# Altium schematic sheet DAC_4493.SchDoc
size 1188 x 840 mm; SheetNumber: 2; SheetTotal: 3
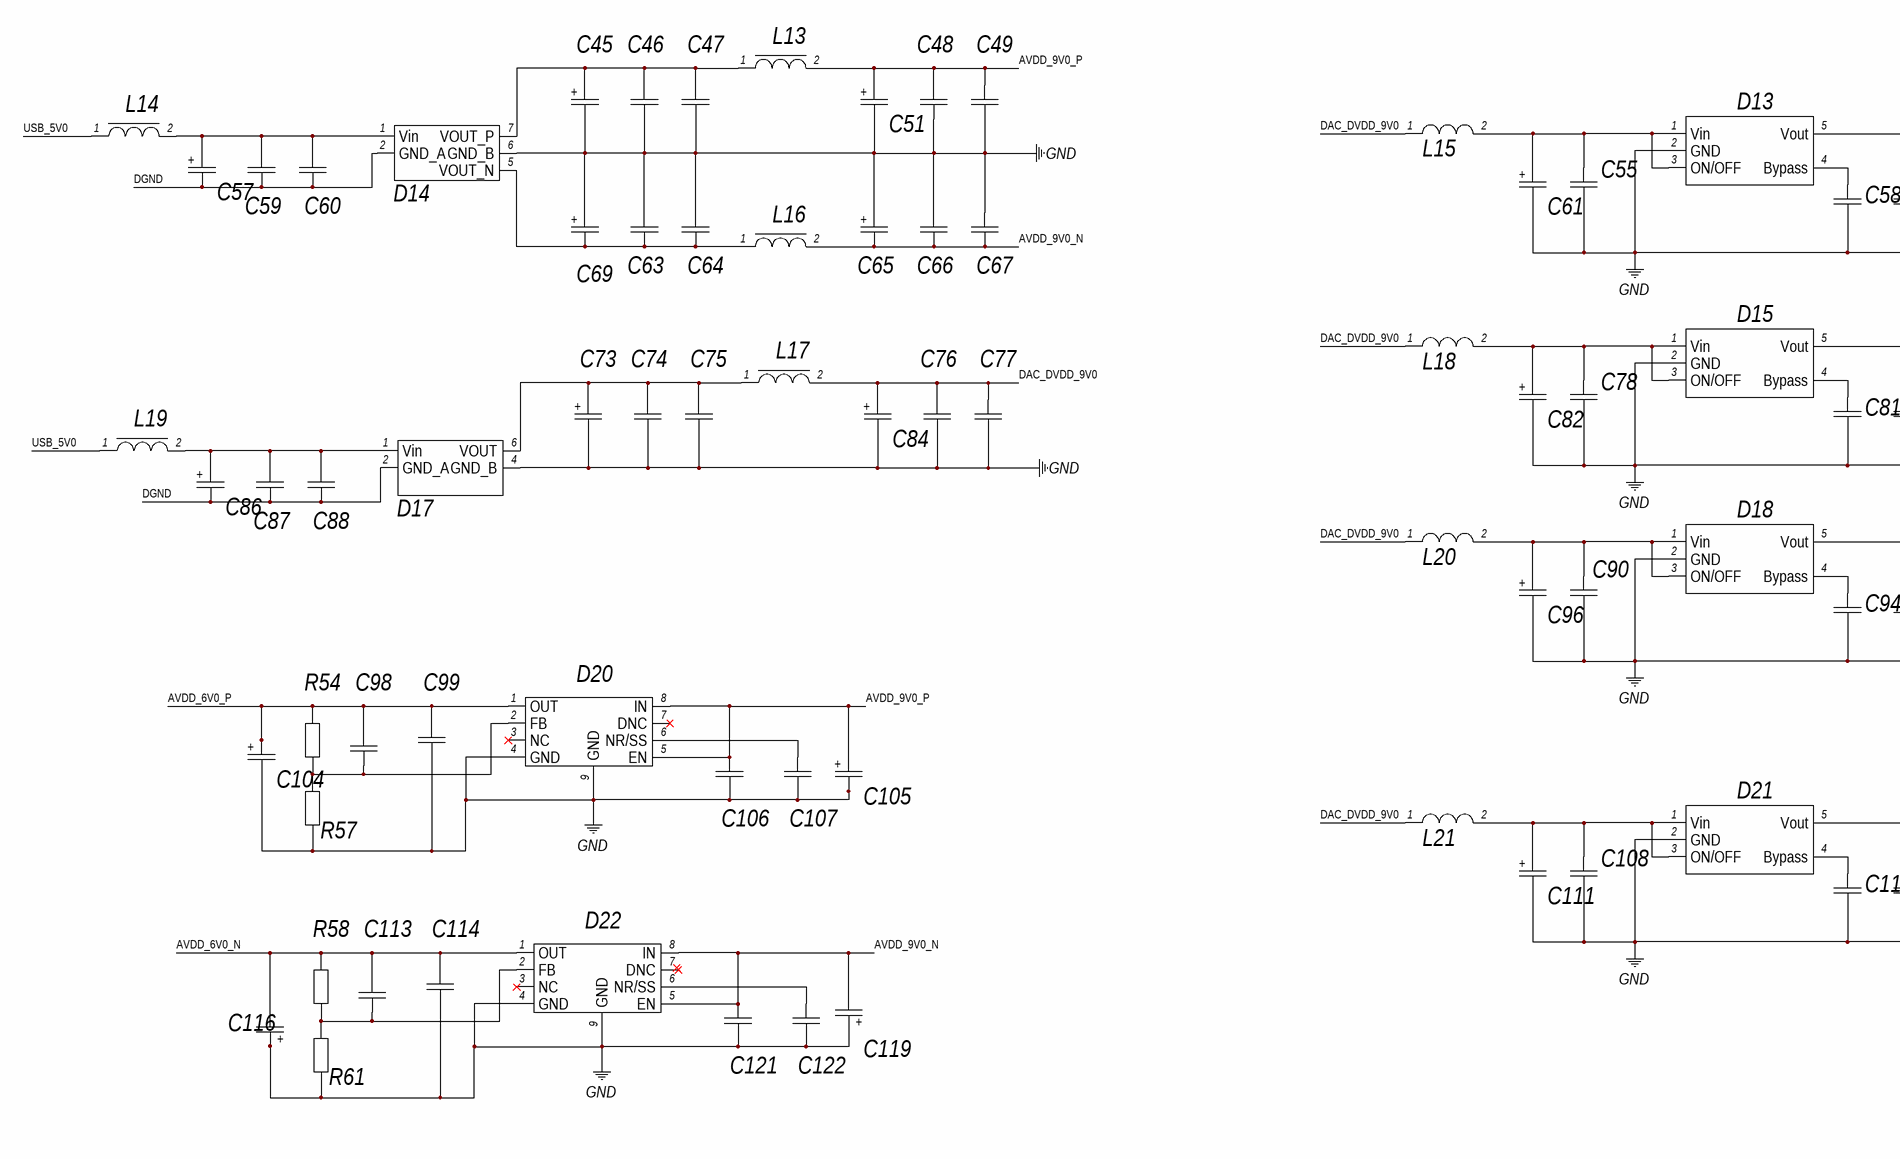
[diagram p0: DAC_4493.SchDoc, top left]
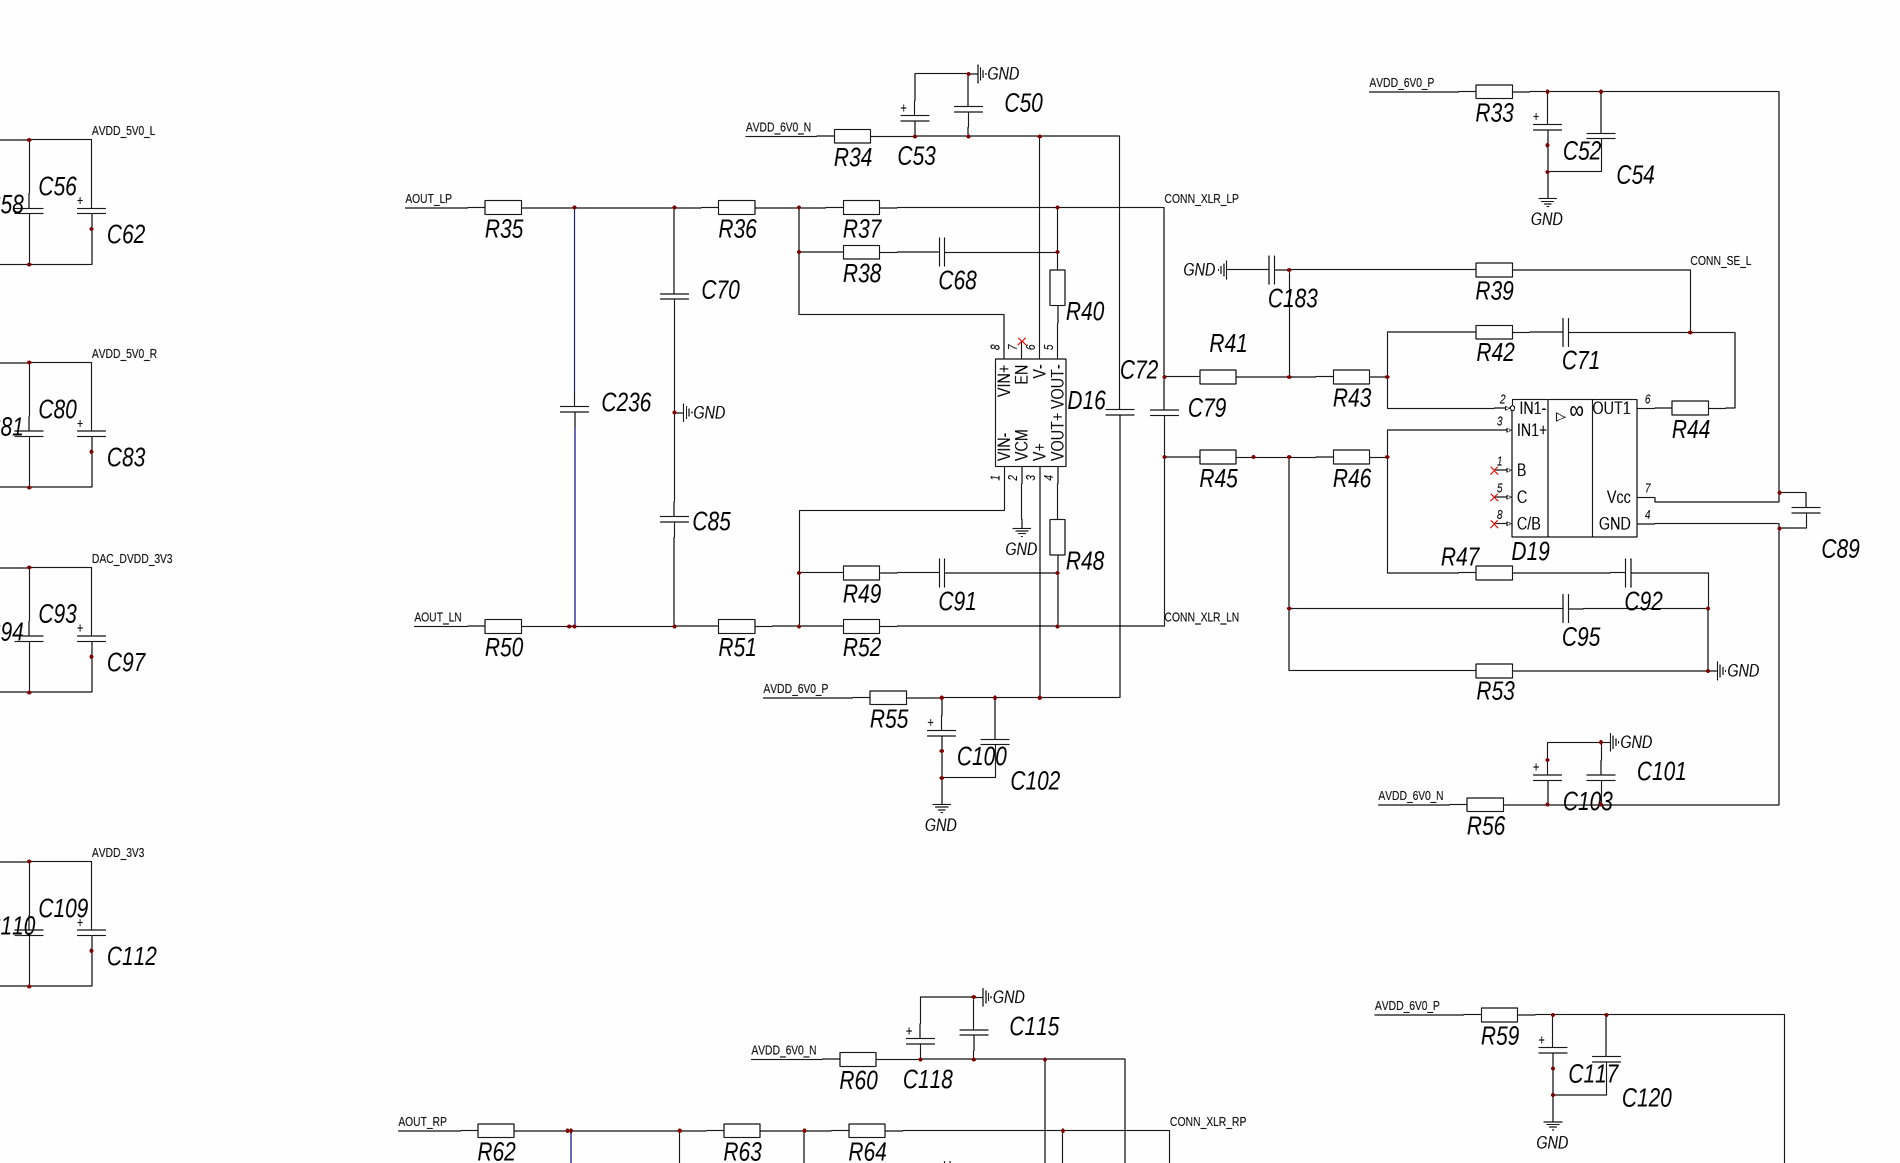
[diagram p1: DAC_4493.SchDoc, top right]
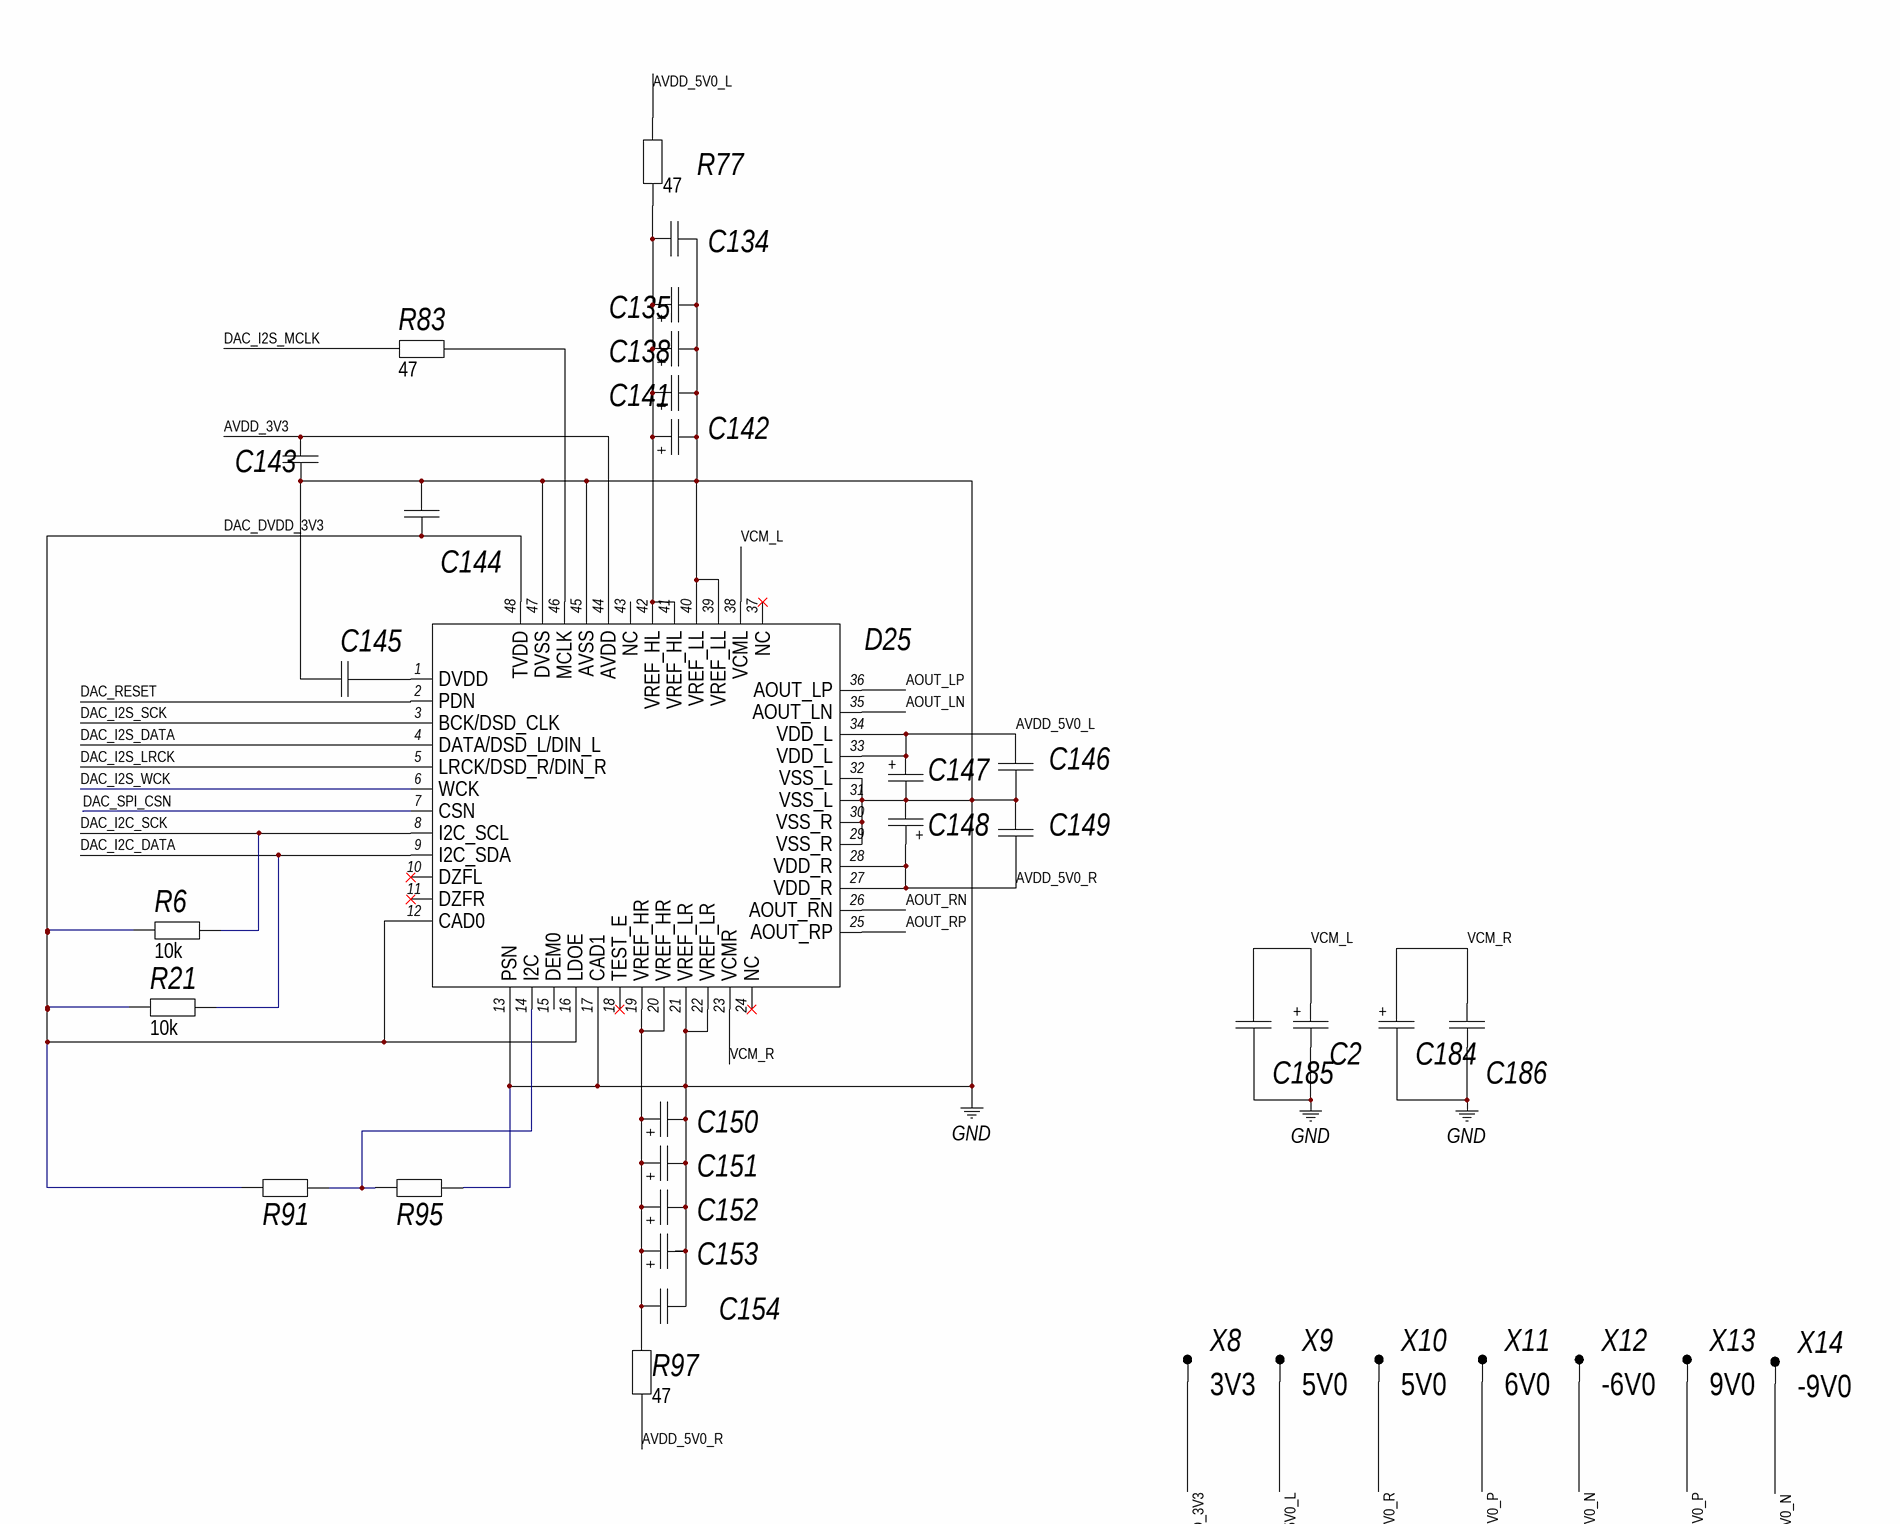
[diagram p2: DAC_4493.SchDoc, bottom left]
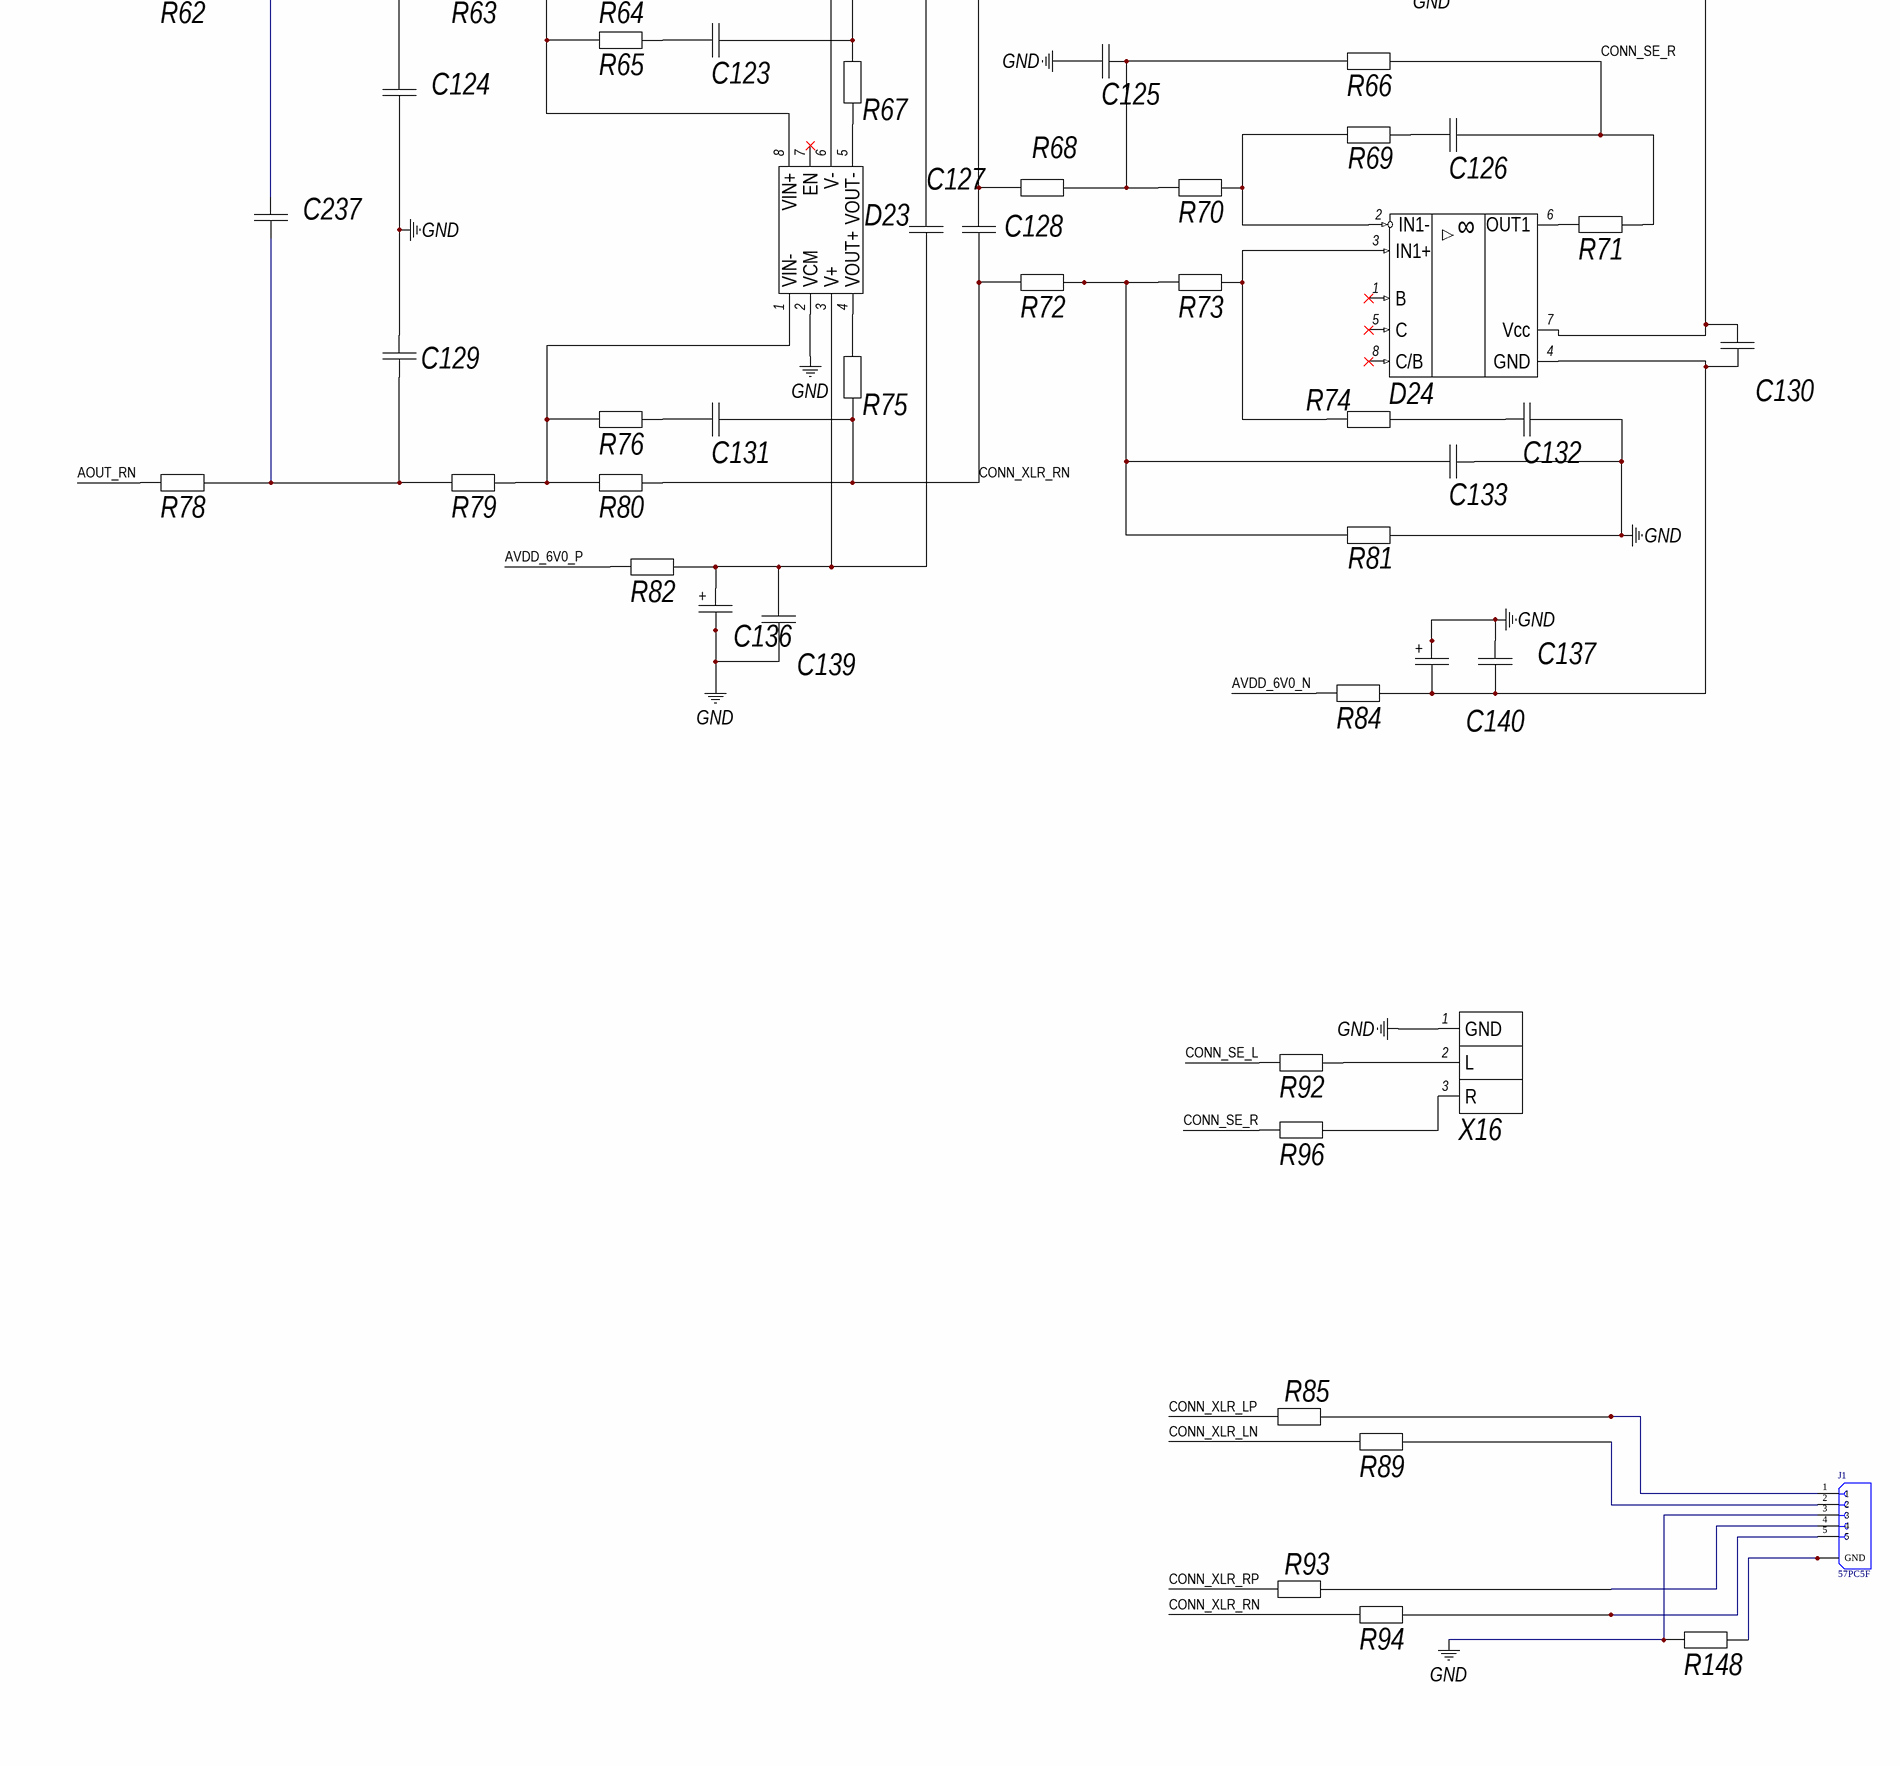
[diagram p3: DAC_4493.SchDoc, bottom right]

## Parts
C2  Обозначение при заказе  [TANT_B]  (value not drawn)
C45  Обозначение при заказе  [TANT_D]  (value not drawn)
C46  CC0805MRX7R9BB104  [CAPC200X125X95L50N]  (value not drawn)
C47  CC0805MRX7R9BB104  [CAPC200X125X95L50N]  (value not drawn)
C48  CC0805MRX7R9BB104  [CAPC200X125X95L50N]  (value not drawn)
C49  CC0805MRX7R9BB104  [CAPC200X125X95L50N]  (value not drawn)
C50  CC0805MRX7R9BB104  [CAPC200X125X95L50N]  (value not drawn)
C51  Обозначение при заказе  [TANT_D]  (value not drawn)
C52  Обозначение при заказе  [TANT_B]  (value not drawn)
C53  Обозначение при заказе  [TANT_B]  (value not drawn)
C54  CC0805MRX7R9BB104  [CAPC200X125X95L50N]  (value not drawn)
C55  CC0805MRX7R9BB104  [CAPC200X125X95L50N]  (value not drawn)
C56  CC0805MRX7R9BB104  [CAPC200X125X95L50N]  (value not drawn)
C57  Обозначение при заказе  [TANT_D]  (value not drawn)
C58  CC0805MRX7R9BB104  [CAPC200X125X95L50N]  (value not drawn)
C59  CC0805MRX7R9BB104  [CAPC200X125X95L50N]  (value not drawn)
C60  CC0805MRX7R9BB104  [CAPC200X125X95L50N]  (value not drawn)
C61  Обозначение при заказе  [TANT_B]  (value not drawn)
C62  Обозначение при заказе  [TANT_B]  (value not drawn)
C63  CC0805MRX7R9BB104  [CAPC200X125X95L50N]  (value not drawn)
C64  CC0805MRX7R9BB104  [CAPC200X125X95L50N]  (value not drawn)
C65  Обозначение при заказе  [TANT_D]  (value not drawn)
C66  CC0805MRX7R9BB104  [CAPC200X125X95L50N]  (value not drawn)
C67  CC0805MRX7R9BB104  [CAPC200X125X95L50N]  (value not drawn)
C68  CC0805MRX7R9BB104  [CAPC200X125X95L50N]  (value not drawn)
C69  Обозначение при заказе  [TANT_D]  (value not drawn)
C70  CC0805MRX7R9BB104  [CAPC200X125X95L50N]  (value not drawn)
C71  CC0805MRX7R9BB104  [CAPC200X125X95L50N]  (value not drawn)
C72  CC0805MRX7R9BB104  [CAPC200X125X95L50N]  (value not drawn)
C73  Обозначение при заказе  [TANT_D]  (value not drawn)
C74  CC0805MRX7R9BB104  [CAPC200X125X95L50N]  (value not drawn)
C75  CC0805MRX7R9BB104  [CAPC200X125X95L50N]  (value not drawn)
C76  CC0805MRX7R9BB104  [CAPC200X125X95L50N]  (value not drawn)
C77  CC0805MRX7R9BB104  [CAPC200X125X95L50N]  (value not drawn)
C78  CC0805MRX7R9BB104  [CAPC200X125X95L50N]  (value not drawn)
C79  CC0805MRX7R9BB104  [CAPC200X125X95L50N]  (value not drawn)
C80  CC0805MRX7R9BB104  [CAPC200X125X95L50N]  (value not drawn)
C81  CC0805MRX7R9BB104  [CAPC200X125X95L50N]  (value not drawn)
C82  Обозначение при заказе  [TANT_B]  (value not drawn)
C83  Обозначение при заказе  [TANT_B]  (value not drawn)
C84  Обозначение при заказе  [TANT_D]  (value not drawn)
C85  CC0805MRX7R9BB104  [CAPC200X125X95L50N]  (value not drawn)
C86  Обозначение при заказе  [TANT_D]  (value not drawn)
C87  CC0805MRX7R9BB104  [CAPC200X125X95L50N]  (value not drawn)
C88  CC0805MRX7R9BB104  [CAPC200X125X95L50N]  (value not drawn)
C89  CC0805MRX7R9BB104  [CAPC200X125X95L50N]  (value not drawn)
C90  CC0805MRX7R9BB104  [CAPC200X125X95L50N]  (value not drawn)
C91  CC0805MRX7R9BB104  [CAPC200X125X95L50N]  (value not drawn)
C92  CC0805MRX7R9BB104  [CAPC200X125X95L50N]  (value not drawn)
C93  CC0805MRX7R9BB104  [CAPC200X125X95L50N]  (value not drawn)
C94  CC0805MRX7R9BB104  [CAPC200X125X95L50N]  (value not drawn)
C95  CC0805MRX7R9BB104  [CAPC200X125X95L50N]  (value not drawn)
C96  Обозначение при заказе  [TANT_B]  (value not drawn)
C97  Обозначение при заказе  [TANT_B]  (value not drawn)
C98  CC0805MRX7R9BB104  [CAPC200X125X95L50N]  (value not drawn)
C99  CC0805MRX7R9BB104  [CAPC200X125X95L50N]  (value not drawn)
C100  Обозначение при заказе  [TANT_B]  (value not drawn)
C101  CC0805MRX7R9BB104  [CAPC200X125X95L50N]  (value not drawn)
C102  CC0805MRX7R9BB104  [CAPC200X125X95L50N]  (value not drawn)
C103  Обозначение при заказе  [TANT_B]  (value not drawn)
C104  Обозначение при заказе  [TANT_B]  (value not drawn)
C105  Обозначение при заказе  [TANT_B]  (value not drawn)
C106  CC0805MRX7R9BB104  [CAPC200X125X95L50N]  (value not drawn)
C107  CC0805MRX7R9BB104  [CAPC200X125X95L50N]  (value not drawn)
C108  CC0805MRX7R9BB104  [CAPC200X125X95L50N]  (value not drawn)
C109  CC0805MRX7R9BB104  [CAPC200X125X95L50N]  (value not drawn)
C110  CC0805MRX7R9BB104  [CAPC200X125X95L50N]  (value not drawn)
C111  Обозначение при заказе  [TANT_B]  (value not drawn)
C112  Обозначение при заказе  [TANT_B]  (value not drawn)
C113  CC0805MRX7R9BB104  [CAPC200X125X95L50N]  (value not drawn)
C114  CC0805MRX7R9BB104  [CAPC200X125X95L50N]  (value not drawn)
C115  CC0805MRX7R9BB104  [CAPC200X125X95L50N]  (value not drawn)
C116  Обозначение при заказе  [TANT_B]  (value not drawn)
C117  Обозначение при заказе  [TANT_B]  (value not drawn)
C118  Обозначение при заказе  [TANT_B]  (value not drawn)
C119  Обозначение при заказе  [TANT_B]  (value not drawn)
C120  CC0805MRX7R9BB104  [CAPC200X125X95L50N]  (value not drawn)
C121  CC0805MRX7R9BB104  [CAPC200X125X95L50N]  (value not drawn)
C122  CC0805MRX7R9BB104  [CAPC200X125X95L50N]  (value not drawn)
C123  CC0805MRX7R9BB104  [CAPC200X125X95L50N]  (value not drawn)
C124  CC0805MRX7R9BB104  [CAPC200X125X95L50N]  (value not drawn)
C125  CC0805MRX7R9BB104  [CAPC200X125X95L50N]  (value not drawn)
C126  CC0805MRX7R9BB104  [CAPC200X125X95L50N]  (value not drawn)
C127  CC0805MRX7R9BB104  [CAPC200X125X95L50N]  (value not drawn)
C128  CC0805MRX7R9BB104  [CAPC200X125X95L50N]  (value not drawn)
C129  CC0805MRX7R9BB104  [CAPC200X125X95L50N]  (value not drawn)
C130  CC0805MRX7R9BB104  [CAPC200X125X95L50N]  (value not drawn)
C131  CC0805MRX7R9BB104  [CAPC200X125X95L50N]  (value not drawn)
C132  CC0805MRX7R9BB104  [CAPC200X125X95L50N]  (value not drawn)
C133  CC0805MRX7R9BB104  [CAPC200X125X95L50N]  (value not drawn)
C134  CC0805MRX7R9BB104  [CAPC200X125X95L50N]  (value not drawn)
C135  Обозначение при заказе  [TANT_D]  (value not drawn)
C136  Обозначение при заказе  [TANT_B]  (value not drawn)
C137  CC0805MRX7R9BB104  [CAPC200X125X95L50N]  (value not drawn)
C138  Обозначение при заказе  [TANT_D]  (value not drawn)
C139  CC0805MRX7R9BB104  [CAPC200X125X95L50N]  (value not drawn)
C140  Обозначение при заказе  [TANT_B]  (value not drawn)
C141  Обозначение при заказе  [TANT_D]  (value not drawn)
C142  Обозначение при заказе  [TANT_D]  (value not drawn)
C143  CC0805MRX7R9BB104  [CAPC200X125X95L50N]  (value not drawn)
C144  CC0805MRX7R9BB104  [CAPC200X125X95L50N]  (value not drawn)
C145  CC0805KKX7R9BB105  [CAPC200X125X95L50N]  (value not drawn)
C146  CC0805MRX7R9BB104  [CAPC200X125X95L50N]  (value not drawn)
C147  Обозначение при заказе  [TANT_D]  (value not drawn)
C148  Обозначение при заказе  [TANT_D]  (value not drawn)
C149  CC0805MRX7R9BB104  [CAPC200X125X95L50N]  (value not drawn)
C150  Обозначение при заказе  [TANT_D]  (value not drawn)
C151  Обозначение при заказе  [TANT_D]  (value not drawn)
C152  Обозначение при заказе  [TANT_D]  (value not drawn)
C153  Обозначение при заказе  [TANT_D]  (value not drawn)
C154  CC0805MRX7R9BB104  [CAPC200X125X95L50N]  (value not drawn)
C183  CC0805MRX7R9BB104  [CAPC200X125X95L50N]  (value not drawn)
C184  Обозначение при заказе  [TANT_B]  (value not drawn)
C185  CC0805MRX7R9BB104  [CAPC200X125X95L50N]  (value not drawn)
C186  CC0805MRX7R9BB104  [CAPC200X125X95L50N]  (value not drawn)
C236  CC0805MRX7R9BB104  [CAPC200X125X95L50N]  (value not drawn)
C237  CC0805MRX7R9BB104  [CAPC200X125X95L50N]  (value not drawn)
D13  Обозначение при заказе  [SOT23-5P95_280X145L45X40N]  (value not drawn)
D14  Обозначение при заказе  [AM3D-0509DH30Z]  (value not drawn)
D15  Обозначение при заказе  [SOT23-5P95_280X145L45X40N]  (value not drawn)
D16  Обозначение при заказе  [SOIC8P127_490X600X175L65X42N]  (value not drawn)
D17  Обозначение при заказе  [AM3D-0509SZ]  (value not drawn)
D18  Обозначение при заказе  [SOT23-5P95_280X145L45X40N]  (value not drawn)
D19  Обозначение при заказе  [SOIC8P127_490X600X175L83X42N]  (value not drawn)
D20  Обозначение при заказе  [SOP65P490X110-9N]  (value not drawn)
D21  Обозначение при заказе  [SOT23-5P95_280X145L45X40N]  (value not drawn)
D22  Обозначение при заказе  [SOP65P490X110-9N]  (value not drawn)
D23  Обозначение при заказе  [SOIC8P127_490X600X175L65X42N]  (value not drawn)
D24  Обозначение при заказе  [SOIC8P127_490X600X175L83X42N]  (value not drawn)
D25  Обозначение при заказе  [QFP50P900X900X160-48N]  (value not drawn)
J1  57PC5F  [SWITCHCRAFT_57PC5F]
L13  CDRH74NP-471MC  [INDM730X730X450L90X180N]  (value not drawn)
L14  CDRH74NP-471MC  [INDM730X730X450L90X180N]  (value not drawn)
L15  Обозначение при заказе  [RESC200X125X60L35]  (value not drawn)
L16  CDRH74NP-471MC  [INDM730X730X450L90X180N]  (value not drawn)
L17  CDRH74NP-471MC  [INDM730X730X450L90X180N]  (value not drawn)
L18  Обозначение при заказе  [RESC200X125X60L35]  (value not drawn)
L19  CDRH74NP-471MC  [INDM730X730X450L90X180N]  (value not drawn)
L20  Обозначение при заказе  [RESC200X125X60L35]  (value not drawn)
L21  Обозначение при заказе  [RESC200X125X60L35]  (value not drawn)
R6  value 10k  [RESC200X125X60L35]  (hidden comment: RC0805JR-0747RL)
R21  value 10k  [RESC200X125X60L35]  (hidden comment: RC0805JR-0747RL)
R33  RC0805JR-0710RL  [RESC200X125X60L35]  (value not drawn)
R34  RC0805JR-0710RL  [RESC200X125X60L35]  (value not drawn)
R35  RC0805JR-072K2L  [RESC200X125X60L35]  (value not drawn)
R36  RC0805JR-072K2L  [RESC200X125X60L35]  (value not drawn)
R37  RC0805JR-072K2L  [RESC200X125X60L35]  (value not drawn)
R38  RC0805JR-072K2L  [RESC200X125X60L35]  (value not drawn)
R39  RC0805JR-072K2L  [RESC200X125X60L35]  (value not drawn)
R40  RC0805JR-0710RL  [RESC200X125X60L35]  (value not drawn)
R41  RC0805JR-072K2L  [RESC200X125X60L35]  (value not drawn)
R42  RC0805JR-072K2L  [RESC200X125X60L35]  (value not drawn)
R43  RC0805JR-072K2L  [RESC200X125X60L35]  (value not drawn)
R44  RC0805JR-0710RL  [RESC200X125X60L35]  (value not drawn)
R45  RC0805JR-072K2L  [RESC200X125X60L35]  (value not drawn)
R46  RC0805JR-072K2L  [RESC200X125X60L35]  (value not drawn)
R47  RC0805JR-072K2L  [RESC200X125X60L35]  (value not drawn)
R48  RC0805JR-0710RL  [RESC200X125X60L35]  (value not drawn)
R49  RC0805JR-072K2L  [RESC200X125X60L35]  (value not drawn)
R50  RC0805JR-072K2L  [RESC200X125X60L35]  (value not drawn)
R51  RC0805JR-072K2L  [RESC200X125X60L35]  (value not drawn)
R52  RC0805JR-072K2L  [RESC200X125X60L35]  (value not drawn)
R53  RC0805JR-072K2L  [RESC200X125X60L35]  (value not drawn)
R54  RC0805JR-071KL  [RESC200X125X60L35]  (value not drawn)
R55  RC0805JR-0710RL  [RESC200X125X60L35]  (value not drawn)
R56  RC0805JR-0710RL  [RESC200X125X60L35]  (value not drawn)
R57  RC0805JR-071KL  [RESC200X125X60L35]  (value not drawn)
R58  RC0805JR-071KL  [RESC200X125X60L35]  (value not drawn)
R59  RC0805JR-0710RL  [RESC200X125X60L35]  (value not drawn)
R60  RC0805JR-0710RL  [RESC200X125X60L35]  (value not drawn)
R61  RC0805JR-071KL  [RESC200X125X60L35]  (value not drawn)
R62  RC0805JR-072K2L  [RESC200X125X60L35]  (value not drawn)
R63  RC0805JR-072K2L  [RESC200X125X60L35]  (value not drawn)
R64  RC0805JR-072K2L  [RESC200X125X60L35]  (value not drawn)
R65  RC0805JR-072K2L  [RESC200X125X60L35]  (value not drawn)
R66  RC0805JR-072K2L  [RESC200X125X60L35]  (value not drawn)
R67  RC0805JR-0710RL  [RESC200X125X60L35]  (value not drawn)
R68  RC0805JR-072K2L  [RESC200X125X60L35]  (value not drawn)
R69  RC0805JR-072K2L  [RESC200X125X60L35]  (value not drawn)
R70  RC0805JR-072K2L  [RESC200X125X60L35]  (value not drawn)
R71  RC0805JR-0710RL  [RESC200X125X60L35]  (value not drawn)
R72  RC0805JR-072K2L  [RESC200X125X60L35]  (value not drawn)
R73  RC0805JR-072K2L  [RESC200X125X60L35]  (value not drawn)
R74  RC0805JR-072K2L  [RESC200X125X60L35]  (value not drawn)
R75  RC0805JR-0710RL  [RESC200X125X60L35]  (value not drawn)
R76  RC0805JR-072K2L  [RESC200X125X60L35]  (value not drawn)
R77  value 47  [RESC200X125X60L35]  (hidden comment: RC0805JR-0747RL)
R78  RC0805JR-072K2L  [RESC200X125X60L35]  (value not drawn)
R79  RC0805JR-072K2L  [RESC200X125X60L35]  (value not drawn)
R80  RC0805JR-072K2L  [RESC200X125X60L35]  (value not drawn)
R81  RC0805JR-072K2L  [RESC200X125X60L35]  (value not drawn)
R82  RC0805JR-0710RL  [RESC200X125X60L35]  (value not drawn)
R83  value 47  [RESC200X125X60L35]  (hidden comment: RC0805JR-0747RL)
R84  RC0805JR-0710RL  [RESC200X125X60L35]  (value not drawn)
R85  RC0805JR-07100RL  [RESC200X125X60L35]  (value not drawn)
R89  RC0805JR-07100RL  [RESC200X125X60L35]  (value not drawn)
R91  RC0805JR-072K2L  [RESC200X125X60L35]  (value not drawn)
R92  RC0805JR-07100RL  [RESC200X125X60L35]  (value not drawn)
R93  RC0805JR-07100RL  [RESC200X125X60L35]  (value not drawn)
R94  RC0805JR-07100RL  [RESC200X125X60L35]  (value not drawn)
R95  RC0805JR-072K2L  [RESC200X125X60L35]  (value not drawn)
R96  RC0805JR-07100RL  [RESC200X125X60L35]  (value not drawn)
R97  value 47  [RESC200X125X60L35]  (hidden comment: RC0805JR-0747RL)
R148  RC0805JR-07100RL  [RESC200X125X60L35]  (value not drawn)
X8  Marck-2: 3V3  [C_P]  (hidden comment: C_P)  (no BOM)
X9  Marck-2: 5V0  [C_P]  (hidden comment: C_P)  (no BOM)
X10  Marck-2: 5V0  [C_P]  (hidden comment: C_P)  (no BOM)
X11  Marck-2: 6V0  [C_P]  (hidden comment: C_P)  (no BOM)
X12  Marck-2: -6V0  [C_P]  (hidden comment: C_P)  (no BOM)
X13  Marck-2: 9V0  [C_P]  (hidden comment: C_P)  (no BOM)
X14  Marck-2: -9V0  [C_P]  (hidden comment: C_P)  (no BOM)
X16  Обозначение при заказе  [ST-008G-04]  (value not drawn)

## Nets
GND: C2.2 C45.2 C46.2 C47.2 C48.2 C49.2 C50.1 C51.2 C52.2 C53.1 C54.2 C55.2 C56.2 C58.2 C61.2 C62.2 C63.1 C64.1 C65.1 C66.1 C67.1 C69.1 C70.2 C73.2 C74.2 C75.2 C76.2 C77.2 C78.2 C80.2 C81.2 C82.2 C83.2 C84.2 C85.1 C90.2 C92.2 C93.2 C94.2 C95.2 C96.2 C97.2 C99.2 C100.2 C101.1 C102.2 C103.1 C104.2 C105.2 C106.2 C107.2 C108.2 C109.2 C110.2 C111.2 C112.2 C114.2 C115.1 C116.1 C117.2 C118.1 C119.1 C120.2 C121.2 C122.2 C124.2 C125.1 C129.1 C132.2 C133.2 C134.1 C135.2 C136.2 C137.1 C138.2 C139.2 C140.1 C141.2 C142.2 C143.1 C144.1 C145.1 C146.2 C147.2 C148.2 C149.1 C150.2 C151.2 C152.2 C153.2 C154.2 C183.1 C184.2 C185.2 C186.2 D13.2(GND) D14.6(GND_B) D15.2(GND) D16.2(VCM) D17.4(GND_B) D18.2(GND) D20.4(GND) D20.9(GND) D21.2(GND) D22.4(GND) D22.9(GND) D23.2(VCM) D25.13(PSN) D25.17(CAD1) D25.21(VREF_LR) D25.22(VREF_LR) D25.29(VSS_R) D25.30(VSS_R) D25.31(VSS_L) D25.32(VSS_L) D25.39(VREF_LL) D25.40(VREF_LL) D25.45(AVSS) D25.47(DVSS) J1.3 R53.2 R57.1 R61.1 R81.2 R95.2 R148.1 X16.1(GND)
AOUT_LN: D25.35(AOUT_LN) R50.1
AOUT_LP: D25.36(AOUT_LP) R35.1
AOUT_RN: D25.26(AOUT_RN) R78.1
AOUT_RP: D25.25(AOUT_RP) R62.1
AVDD_3V3: C109.1 C112.1 C143.2 D21.5(Vout) D25.44(AVDD) X8.1
AVDD_5V0_L: C56.1 C62.1 C146.1 C147.1 D13.5(Vout) D25.33(VDD_L) D25.34(VDD_L) R77.2 X9.1
AVDD_5V0_R: C80.1 C83.1 C148.1 C149.2 D15.5(Vout) D25.27(VDD_R) D25.28(VDD_R) R97.1 X10.1
AVDD_6V0_N: C113.1 C114.1 C116.2 D22.1(OUT) R34.1 R56.1 R58.2 R60.1 R84.1 X12.1
AVDD_6V0_P: C98.1 C99.1 C104.1 D20.1(OUT) R33.1 R54.2 R55.1 R59.1 R82.1 X11.1
AVDD_9V0_N: C65.2 C66.2 C67.2 C119.2 C121.1 D22.5(EN) D22.8(IN) L16.2 X14.1
AVDD_9V0_P: C48.1 C49.1 C51.1 C105.1 C106.1 D20.5(EN) D20.8(IN) L13.2 X13.1
CONN_SE_L: C71.2 R39.2 R44.2 R92.1
CONN_SE_R: C126.2 R66.2 R71.2 R96.1
CONN_XLR_LN: C79.1 C91.2 R45.1 R48.1 R52.2 R89.1
CONN_XLR_LP: C68.2 C79.2 R37.2 R40.2 R41.1 R85.1
CONN_XLR_RN: C128.2 C131.2 R72.1 R75.1 R80.2 R94.1
CONN_XLR_RP: C123.2 C128.1 R64.2 R67.2 R68.1 R93.1
DAC_DVDD_3V3: C93.1 C97.1 C144.2 D18.5(Vout) D25.12(CAD0) D25.16(LDOE) D25.48(TVDD) R6.1 R21.1 R91.1
DAC_DVDD_9V0: C76.1 C77.1 C84.1 L15.1 L17.2 L18.1 L20.1 L21.1
DAC_I2C_DATA: D25.9(I2C_SDA) R21.2
DAC_I2C_SCK: D25.8(I2C_SCL) R6.2
DAC_I2S_DATA: D25.4(DATA/DSD_L/DIN_L)
DAC_I2S_LRCK: D25.5(LRCK/DSD_R/DIN_R)
DAC_I2S_MCLK: R83.1
DAC_I2S_SCK: D25.3(BCK/DSD_CLK)
DAC_I2S_WCK: D25.6(WCK)
DAC_RESET: D25.2(PDN)
DAC_SPI_CSN: D25.7(CSN)
DGND: C57.2 C59.2 C60.2 C86.2 C87.2 C88.2 D14.2(GND_A) D17.2(GND_A)
USB_5V0: L14.1 L19.1
VCM_L: C2.1 C185.1 D25.38(VCML)
VCM_R: C184.1 C186.1 D25.23(VCMR)
NetC45_1: C45.1 C46.1 C47.1 D14.7(VOUT_P) L13.1
NetC50_2: C50.2 C53.2 C72.1 D16.6(V-) R34.2
NetC52_1: C52.1 C54.1 C89.1 D19.7(Vcc) R33.2
NetC55_1: C55.1 C61.1 D13.1(Vin) D13.3(ON/OFF) L15.2
NetC57_1: C57.1 C59.1 C60.1 D14.1(Vin) L14.2
NetC58_1: C58.1 D13.4(Bypass)
NetC63_2: C63.2 C64.2 C69.2 D14.5(VOUT_N) L16.1
NetC68_1: C68.1 R38.2
NetC70_1: C70.1 C236.1 R35.2 R36.1
NetC71_1: C71.1 R42.2
NetC72_2: C72.2 C100.1 C102.1 D16.3(V+) R55.2
NetC73_1: C73.1 C74.1 C75.1 D17.6(VOUT) L17.1
NetC78_1: C78.1 C82.1 D15.1(Vin) D15.3(ON/OFF) L18.2
NetC81_1: C81.1 D15.4(Bypass)
NetC85_2: C85.2 C236.2 R50.2 R51.1
NetC86_1: C86.1 C87.1 C88.1 D17.1(Vin) L19.2
NetC89_2: C89.2 C101.2 C103.2 D19.4(GND) R56.2
NetC90_1: C90.1 C96.1 D18.1(Vin) D18.3(ON/OFF) L20.2
NetC91_1: C91.1 R49.2
NetC92_1: C92.1 R47.2
NetC94_1: C94.1 D18.4(Bypass)
NetC95_1: C95.1 R45.2 R46.1 R53.1
NetC98_2: C98.2 D20.2(FB) R54.1 R57.2
NetC107_1: C107.1 D20.6(NR/SS)
NetC108_1: C108.1 C111.1 D21.1(Vin) D21.3(ON/OFF) L21.2
NetC110_1: C110.1 D21.4(Bypass)
NetC113_2: C113.2 D22.2(FB) R58.1 R61.2
NetC115_2: C115.2 C118.2 C127.1 D23.6(V-) R60.2
NetC117_1: C117.1 C120.1 C130.1 D24.7(Vcc) R59.2
NetC122_1: C122.1 D22.6(NR/SS)
NetC123_1: C123.1 R65.2
NetC124_1: C124.1 C237.1 R62.2 R63.1
NetC125_2: C125.2 R66.1 R68.2 R70.1
NetC126_1: C126.1 R69.2
NetC127_2: C127.2 C136.1 C139.1 D23.3(V+) R82.2
NetC129_2: C129.2 C237.2 R78.2 R79.1
NetC130_2: C130.2 C137.2 C140.2 D24.4(GND) R84.2
NetC131_1: C131.1 R76.2
NetC132_1: C132.1 R74.2
NetC133_1: C133.1 R72.2 R73.1 R81.1
NetC134_2: C134.2 C135.1 C138.1 C141.1 C142.1 D25.41(VREF_HL) D25.42(VREF_HL) R77.1
NetC145_2: C145.2 D25.1(DVDD)
NetC150_1: C150.1 C151.1 C152.1 C153.1 C154.1 D25.19(VREF_HR) D25.20(VREF_HR) R97.2
NetC183_2: C183.2 R39.1 R41.2 R43.1
NetD16_1: D16.1(VIN-) R49.1 R51.2 R52.1
NetD16_4: D16.4(VOUT+) R48.2
NetD16_5: D16.5(VOUT-) R40.1
NetD16_8: D16.8(VIN+) R36.2 R37.1 R38.1
NetD19_2: D19.2(IN1-) R42.1 R43.2
NetD19_3: D19.3(IN1+) R46.2 R47.1
NetD19_6: D19.6(OUT1) R44.1
NetD23_1: D23.1(VIN-) R76.1 R79.2 R80.1
NetD23_4: D23.4(VOUT+) R75.2
NetD23_5: D23.5(VOUT-) R67.1
NetD23_8: D23.8(VIN+) R63.2 R64.1 R65.1
NetD24_2: D24.2(IN1-) R69.1 R70.2
NetD24_3: D24.3(IN1+) R73.2 R74.1
NetD24_6: D24.6(OUT1) R71.1
NetD25_14: D25.14(I2C) R91.2 R95.1
NetD25_46: D25.46(MCLK) R83.2
NetJ1_1: J1.1 R85.2
NetJ1_2: J1.2 R89.2
NetJ1_4: J1.4 R93.2
NetJ1_5: J1.5 R94.2
NetJ1_G1: J1.G1(GND) J1.G2(GND) R148.2
NetR92_2: R92.2 X16.2(L)
NetR96_2: R96.2 X16.3(R)

Not connected (* = marked no-connect by the designer): D16 7(EN)*; D19 1(B)* 5(C)* 8(C/B)*; D20 3(NC)* 7(DNC)*; D22 3(NC)* 7(DNC)*; D23 7(EN)*; D24 1(B)* 5(C)* 8(C/B)*; D25 10(DZFL)* 11(DZFR)* 15(DEM0) 18(TEST_E)* 24(NC)* 37(NC)* 43(NC)

## Notes on the sheet
- Подп. дата
- Инв. № дубл.
- Взам. инв. №
- Подп. и дата
- Инв. № подл.
- Изм.
- Лист
- № докум.
- Подп.
- Дата
- ALTIUM GOSTBOM2.0 KEV
- Файл:
- Копировал
- Формат А0
- (in symbol TANT_B) +
- (in symbol TANT_D) +
- (in symbol TL061) ∞

## Library data of the parts
C2 C52 C53 C61 C62 C82 C83 C96 C97 C100 C103-C105 C111 C112 C116-C119 C136 C140 C184 = TANT_B: Описание свойств компонента
C45 C51 C57 C65 C69 C73 C84 C86 C135 C138 C141 C142 C147 C148 C150-C153 = TANT_D: Описание свойств компонента
C46-C50 C54-C56 C58-C60 C63 C64 C66-C68 C70-C72 C74-C81 C85 C87-C95 C98 C99 C101 C102 C106-C110 C113-C115 C120-C134 C137 C139 C143 C144 C146 C149 C154 C183 C185 C186 C236 C237 = CC0805MRX7R9BB104: Ceramic capacitor 0805 X7R 0.1µF 50V; Manufacturer 1: Yageo; Tolerance: 20%; Capacitance: 100nF; Value: 0.1u; Type: Конденсатор; Supplier 1: Digi-Key; Supplier Part Number 1: 311-4351-1-ND; Manufacturer Part Number 1: CC0805MRX7R9BB104; RoHS: Yes; Category: Ceramic Capacitors; Stock 1: 29978; Pricing 1: 1=0,15000, 10=0,10700, 50=0,06080, 100=0,05040, 500=0,03536, 1000=0,02927 (USD); Mount: SMT; Case/Package: 0805; Min Operating Temperature: -55°C; Max Operating Temperature: 125°C; Packaging: Tape and Reel; Dielectric: X7R; Voltage Rating: 50V; Voltage Rating (DC): 50V; Series: CC; Length: 0.079inch; Width: 0.049inch; Thickness: 0.037inch; Depth: 1.25mm; Lead Free: Lead Free; Halogen Free: Halogen Free; RoHS Compliant: Yes; ComponentLink1URL: https://datasheet.ciiva.com/13207/upy-gphc-x7r-6-3v-to-50v-8-12304-13207535.pdf?src-supplier=Mouser; ComponentLink1Description: https://datasheet.ciiva.com/13207/upy-gphc-x7r-6-3v-to-50v-8-12304-13207535.pdf?src-supplier=Mouser; Case Code (Imperial): 0805; Case Code (Metric): 2012; Voltage: 50V
C145 = CC0805KKX7R9BB105: Ceramic capacitor 0805 X7R 1uF 50V; Tolerance: 10%; Value: 1u; Type: Конденсатор; Supplier 1: Digi-Key; Supplier Part Number 1: 311-4349-1-ND; Supplier 2: Digi-Key; Manufacturer 2: Yageo; Manufacturer Part Number 2: CC0805KKX7R9BB105; RoHS: Yes; Category: Ceramic Capacitors; Stock 2: 48794; Pricing 2: 1=0,26000, 10=0,17900, 50=0,11920, 100=0,10130, 500=0,07152, 1000=0,06257 (USD); Mount: SMT; Case/Package: 0805; Case Code (Imperial): 0805; Case Code (Metric): 2012; Weight: 0.000194oz; Min Operating Temperature: -55°C; Max Operating Temperature: 125°C; Capacitance: 1uF; Dielectric: X7R; Packaging: Tape and Reel; Voltage Rating: 50V; Voltage Rating (DC): 50V; Termination: SMD/SMT; Resistor Type: Ceramic; Series: CC; Construction: Flat; Length: 2mm; Width: 0.049inch; Height: 1.25mm; Thickness: 0.057inch; Depth: 1.25mm; Radiation Hardening: No; Lead Free: Lead Free; Halogen Free: Halogen Free; RoHS Compliant: Yes; ComponentLink1URL: https://datasheet.ciiva.com/13209/upy-gphc-x7r-6-3v-to-50v-8-12304-13209375.pdf?src-supplier=Mouser; ComponentLink1Description: https://datasheet.ciiva.com/13209/upy-gphc-x7r-6-3v-to-50v-8-12304-13209375.pdf?src-supplier=Mouser; Supplier Part Number 2: 311-1886-1-ND; Voltage: 50V
D13 D15 D18 D21 = LP2985: Описание свойств компонента
D14 = AM3D-0509DH30Z: Описание свойств компонента
D16 D23 = OPA1632_SOIC: Описание свойств компонента
D17 = AM3D-0509SZ: Описание свойств компонента
D19 D24 = TL061: Описание свойств компонента
D20 D22 = TPS7A4901/3001: Описание свойств компонента
D25 = AK4490_TQFP: Описание свойств компонента
J1 = 57PC5F: DIN Receptacle Receptacle 5 Female PCB Mount | Switchcraft 57PC5F; MF: Switchcraft Inc.; SnapEDA_Link: https://www.snapeda.com/parts/57PC5F/SWITCHCRAFT/view-part/?ref=snap; Package: None; Value: *; MP: 57PC5F; Check_prices: https://www.snapeda.com/parts/57PC5F/SWITCHCRAFT/view-part/?ref=eda
L13 L14 L16 L17 L19 = CDRH74NP-471MC: Shielded Inductors 470 uH, 260 mA, 3.01 Ohm; Type: Катушка индуктивности; Value: CDRH74; Case/Package: SMD-2; Mount: SMT; Supplier 1: Avnet; Supplier Part Number 1: CDRH74NP-471MC-B
L15 L18 L20 L21 = SMD_BLM0805: Описание свойств компонента
R6 R21 R77 R83 R97 = RC0805JR-0747RL: Chip Resistor Surface Mount 0805 47 Ом; Manufacturer 1: Yageo; Manufacturer Part Number 1: RC0805JR-0718RL; Tolerance: 5%; Resistance: 47R; Temperature Coefficient: 100ppm/°C; Power Rating: 125mW; Voltage Rating: 150V; RoHS: Yes; Category: Chip SMD Resistors; Stock 1: 12330; Pricing 1: 1=0,03540, 10=0,01050, 25=0,01040, 100=0,00430, 250=0,00420, 1000=0,00230, 3000=0,00210, 6000=0,00180 (USD); Case/Package: 0805; Contact Plating: Tin,Matte,Lead; Case Code (Metric): 2012; Case Code (Imperial): 0805; Size Code: 0805; Min Operating Temperature: -55°C; Max Operating Temperature: 155°C; Resistor Type: Thick Film; Package Quantity: 1; Packaging: Tape and Reel; Number of Terminations: 2; Termination: SMD/SMT; Max Power Dissipation: 125mW; Features: Moisture Resistant; Series: RC; Construction: Rectangular; Resistance Tolerance: 5%; Length: 2mm; Width: 0.049inch; Height: 0.024inch; Depth: 1.25mm; Radiation Hardening: No; REACH SVHC: Unknown; Military Standard: Not; Lead Free: Lead Free; RoHS Compliant: Yes; ComponentLink1URL: https://datasheet.ciiva.com/2508/pyu-r-int-thick-7-2508730.pdf?src-supplier=Digi-Key; ComponentLink1Description: https://datasheet.ciiva.com/2508/pyu-r-int-thick-7-2508730.pdf?src-supplier=Digi-Key; ComponentLink2URL: https://datasheet.ciiva.com/2508/pyu-r-int-thick-7-2508731.pdf?src-supplier=Digi-Key; ComponentLink2Description: https://datasheet.ciiva.com/2508/pyu-r-int-thick-7-2508731.pdf?src-supplier=Digi-Key; ComponentLink3URL: https://datasheet.ciiva.com/2508/pyu-r-int-thick-7-2508729.pdf?src-supplier=Digi-Key; ComponentLink3Description: https://datasheet.ciiva.com/2508/pyu-r-int-thick-7-2508729.pdf?src-supplier=Digi-Key; ComponentLink4URL: https://datasheet.ciiva.com/12558/rc0805-257173-12558905.pdf?src-supplier=Mouser; ComponentLink4Description: https://datasheet.ciiva.com/12558/rc0805-257173-12558905.pdf?src-supplier=Mouser; ComponentLink5URL: https://datasheet.ciiva.com/7941/442941-7941903.pdf?src-supplier=Element14; ComponentLink5Description: https://datasheet.ciiva.com/7941/442941-7941903.pdf?src-supplier=Element14; ComponentLink6URL: https://datasheet.ciiva.com/17043/rc0805-17043703.pdf?src-supplier=Future+Electronics; ComponentLink6Description: https://datasheet.ciiva.com/17043/rc0805-17043703.pdf?src-supplier=Future+Electronics; Mount: SMT; Type: Резистор; Supplier 1: Farnell; Supplier Part Number 1: 1799501
R33 R34 R40 R44 R48 R55 R56 R59 R60 R67 R71 R75 R82 R84 = RC0805JR-0710RL: Chip Resistor Surface Mount 0805 10 Ом; Manufacturer 1: Yageo; Tolerance: 5%; Resistance: 10R; Temperature Coefficient: 200ppm/°C; Voltage Rating: 150V; Power Rating: 125mW; Value: 10; Supplier 1: Arrow Electronics; Supplier Part Number 1: RC0805JR-0710RL; Manufacturer Part Number 1: RC0805JR-0710RL; RoHS: Yes; Category: Chip SMD Resistors; Stock 1: 27; Pricing 1: 1=0,07580, 10=0,05800, 25=0,05130 (USD); Case/Package: 0805; Contact Plating: Tin,Matte,Lead; Case Code (Imperial): 0805; Case Code (Metric): 2012; Size Code: 0805; Min Operating Temperature: -55°C; Max Operating Temperature: 155°C; Packaging: Tape and Reel; Resistor Type: Thick Film; Package Quantity: 1; Termination: SMD/SMT; Number of Terminations: 2; Max Power Dissipation: 125mW; Features: Moisture Resistant; Series: RC; Resistance Tolerance: 5%; Length: 0.079inch; Width: 0.049inch; Height: 0.024inch; Radiation Hardening: No; REACH SVHC: Unknown; Lead Free: Lead Free; RoHS Compliant: Yes; ComponentLink1URL: https://datasheet.ciiva.com/46395/444164-46395129.pdf?src-supplier=Element14; ComponentLink1Description: https://datasheet.ciiva.com/46395/444164-46395129.pdf?src-supplier=Element14; ComponentLink2URL: https://datasheet.ciiva.com/2456/pyu-r-int-thick-7-2456041.pdf?src-supplier=Digi-Key; ComponentLink2Description: https://datasheet.ciiva.com/2456/pyu-r-int-thick-7-2456041.pdf?src-supplier=Digi-Key; ComponentLink3URL: https://datasheet.ciiva.com/2456/pyu-r-int-thick-7-2456042.pdf?src-supplier=Digi-Key; ComponentLink3Description: https://datasheet.ciiva.com/2456/pyu-r-int-thick-7-2456042.pdf?src-supplier=Digi-Key; ComponentLink4URL: https://datasheet.ciiva.com/2456/pyu-r-int-thick-7-2456040.pdf?src-supplier=Digi-Key; ComponentLink4Description: https://datasheet.ciiva.com/2456/pyu-r-int-thick-7-2456040.pdf?src-supplier=Digi-Key; ComponentLink5URL: https://datasheet.ciiva.com/12667/rc0805-12667031.pdf?src-supplier=Mouser; ComponentLink5Description: https://datasheet.ciiva.com/12667/rc0805-12667031.pdf?src-supplier=Mouser; Mount: SMT; Type: Резистор
R35-R39 R41-R43 R45-R47 R49-R53 R62-R66 R68-R70 R72-R74 R76 R78-R81 R91 R95 = RC0805JR-072K2L: Chip Resistor Surface Mount 0805 2,2 кОм; Manufacturer 1: Yageo; Resistance: 2.2kR; Tolerance: 5%; Temperature Coefficient: 100ppm/°C; Power Rating: 125mW; Voltage Rating: 150V; Value: 2k2; Supplier 1: Arrow Electronics; Supplier Part Number 1: RC0805JR-072K2L; Manufacturer Part Number 1: RC0805JR-072K2L; RoHS: Yes; Category: Chip SMD Resistors; Stock 1: 135000; Pricing 1: 5000=0,00590, 10000=0,00350 (USD); Case/Package: 0805; Contact Plating: Tin,Lead,Matte; Case Code (Imperial): 0805; Case Code (Metric): 2012; Size Code: 0805; Min Operating Temperature: -55°C; Max Operating Temperature: 155°C; Resistor Type: Thick Film; Packaging: Tape and Reel; Termination: SMD/SMT; Features: Moisture Resistant; Series: RC; Max Power Dissipation: 125mW; Number of Terminations: 2; Construction: Rectangular; Resistance Tolerance: 5%; Length: 2mm; Depth: 1.25mm; Radiation Hardening: No; REACH SVHC: Unknown; Lead Free: Lead Free; RoHS Compliant: Yes; Military Standard: Not; ComponentLink1URL: https://datasheet.ciiva.com/12667/rc0805-12667397.pdf?src-supplier=Mouser; ComponentLink1Description: https://datasheet.ciiva.com/12667/rc0805-12667397.pdf?src-supplier=Mouser; ComponentLink2URL: https://datasheet.ciiva.com/7941/442941-7941935.pdf?src-supplier=Element14; ComponentLink2Description: https://datasheet.ciiva.com/7941/442941-7941935.pdf?src-supplier=Element14; ComponentLink3URL: https://datasheet.ciiva.com/15190/getdatasheetpartid-251869-15190044.pdf?src-supplier=Verical; ComponentLink3Description: https://datasheet.ciiva.com/15190/getdatasheetpartid-251869-15190044.pdf?src-supplier=Verical; Mount: SMT; Type: Резистор
R54 R57 R58 R61 = RC0805JR-071KL: Chip Resistor Surface Mount 0805 1 кОм; Manufacturer 1: Yageo; Resistance: 1kR; Tolerance: 5%; Temperature Coefficient: 100ppm/°C; Power Rating: 125mW; Voltage Rating: 150V; Value: 1k; Supplier 1: RSComponents; Supplier Part Number 1: 1995761; Manufacturer Part Number 1: RC0805JR-071KL; RoHS: Yes; Category: Chip SMD Resistors; Stock 1: 22200; Pricing 1: 5000=0,00300 (GBP); Case/Package: 0805; Contact Plating: Tin,Lead,Matte; Case Code (Imperial): 0805; Case Code (Metric): 2012; Size Code: 0805; Min Operating Temperature: -55°C; Max Operating Temperature: 155°C; Resistor Type: Thick Film; Packaging: Tape and Reel; Termination: SMD/SMT; Features: Moisture Resistant; Series: RC; Max Power Dissipation: 125mW; Number of Terminations: 2; Resistance Tolerance: 5%; Construction: Rectangular; Length: 2mm; Depth: 1.25mm; Radiation Hardening: No; REACH SVHC: Unknown; Lead Free: Lead Free; Military Standard: Not; RoHS Compliant: Yes; ComponentLink1URL: https://datasheet.ciiva.com/46395/444164-46395131.pdf?src-supplier=Element14; ComponentLink1Description: https://datasheet.ciiva.com/46395/444164-46395131.pdf?src-supplier=Element14; ComponentLink2URL: https://datasheet.ciiva.com/12667/rc0805-12667110.pdf?src-supplier=Mouser; ComponentLink2Description: https://datasheet.ciiva.com/12667/rc0805-12667110.pdf?src-supplier=Mouser; ComponentLink3URL: https://datasheet.ciiva.com/7941/442941-7941911.pdf?src-supplier=Element14; ComponentLink3Description: https://datasheet.ciiva.com/7941/442941-7941911.pdf?src-supplier=Element14; ComponentLink4URL: https://datasheet.ciiva.com/7941/442941-7941912.pdf?src-supplier=Element14; ComponentLink4Description: https://datasheet.ciiva.com/7941/442941-7941912.pdf?src-supplier=Element14; ComponentLink5URL: https://datasheet.ciiva.com/15190/getdatasheetpartid-135056-15190037.pdf?src-supplier=Verical; ComponentLink5Description: https://datasheet.ciiva.com/15190/getdatasheetpartid-135056-15190037.pdf?src-supplier=Verical; Mount: SMT; Type: Резистор
R85 R89 R92-R94 R96 R148 = RC0805JR-07100RL: Chip Resistor Surface Mount 0805 100 Ом; Manufacturer 1: Yageo; Tolerance: 5%; Resistance: 100R; Temperature Coefficient: 100ppm/°C; Power Rating: 125mW; Voltage Rating: 150V; Value: 100; Supplier 1: Avnet; Supplier Part Number 1: RC0805JR-07100RL; Manufacturer Part Number 1: RC0805JR-07100RL; RoHS: Yes; Category: Chip SMD Resistors; Stock 1: 585000; Pricing 1: 5000=0,00202, 10000=0,00199, 20000=0,00193 (USD); Case/Package: 0805; Contact Plating: Tin,Matte,Lead; Case Code (Imperial): 0805; Case Code (Metric): 2012; Size Code: 0805; Min Operating Temperature: -55°C; Max Operating Temperature: 155°C; Resistor Type: Thick Film; Packaging: Tape and Reel; Termination: SMD/SMT; Features: Moisture Resistant; Series: RC; Max Power Dissipation: 125mW; Number of Terminations: 2; Resistance Tolerance: 5%; Radiation Hardening: No; REACH SVHC: Unknown; Lead Free: Lead Free; RoHS Compliant: Yes; Mount: SMT; Type: Резистор
X8-X14 = C_P: Контрольная площадка; Value: 0; Marck-1: *; Case/Package: SMD-1; Mount: SMT; Type: Точка контрольная
X16 = ST-008G-04: Описание свойств компонента